# EAGLE design msx_slot2bus_expander (EAGLE 7.6.0)
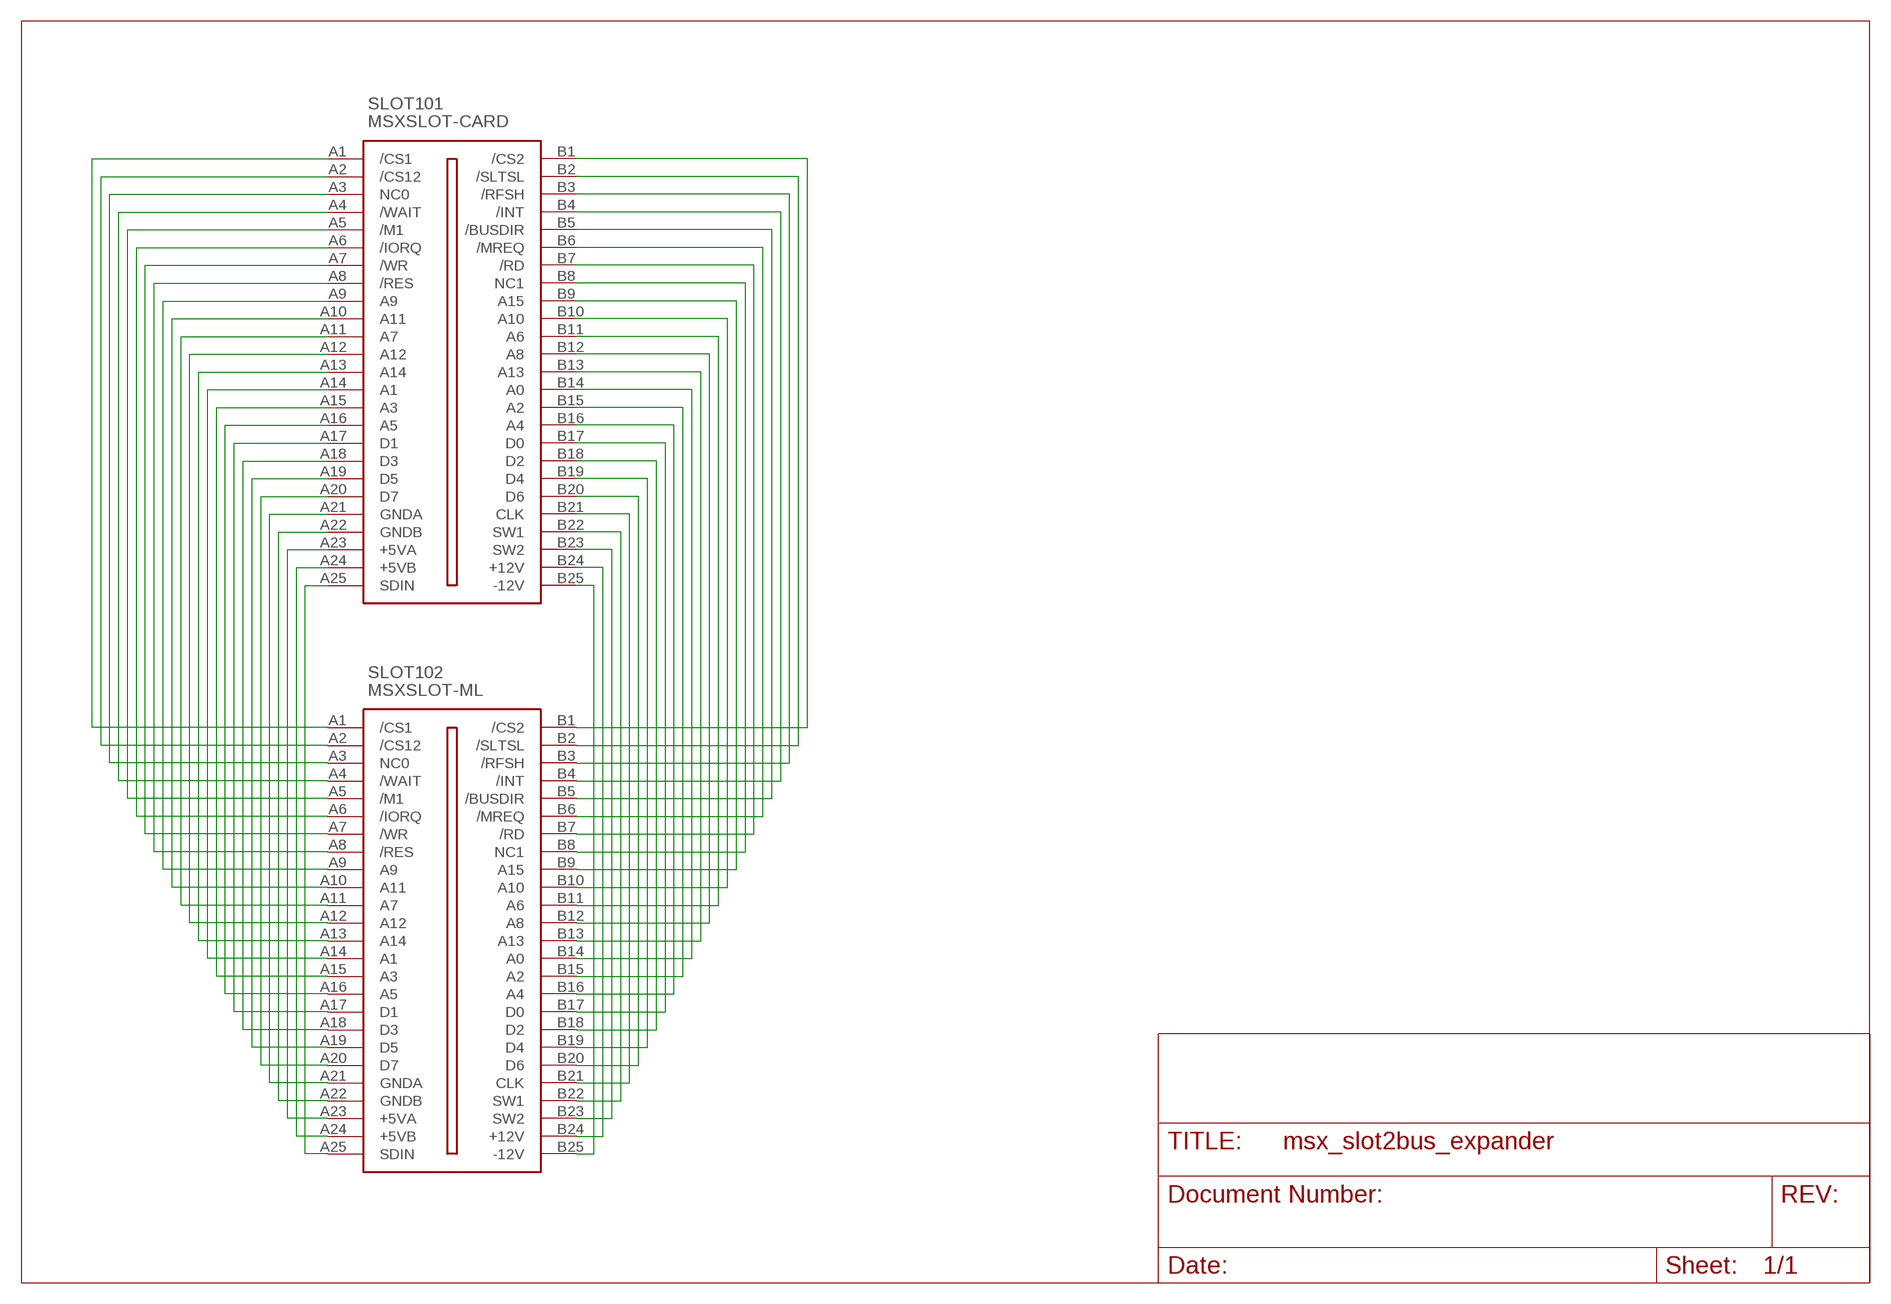
[diagram p0: schematic, sheet 1]

## Parts
SLOT101  MSXSLOT-CARD  [MSXCARD]
SLOT102  MSXSLOT-ML  [MSXSLOT-ML]

## Nets
N$1: SLOT101.A1(/CS1) SLOT102.A1(/CS1)
N$2: SLOT101.A2(/CS12) SLOT102.A2(/CS12)
N$3: SLOT101.A3(NC0) SLOT102.A3(NC0)
N$4: SLOT101.A4(/WAIT) SLOT102.A4(/WAIT)
N$5: SLOT101.A5(/M1) SLOT102.A5(/M1)
N$6: SLOT101.A6(/IORQ) SLOT102.A6(/IORQ)
N$7: SLOT101.A7(/WR) SLOT102.A7(/WR)
N$8: SLOT101.A8(/RES) SLOT102.A8(/RES)
N$9: SLOT101.A9 SLOT102.A9
N$10: SLOT101.A10(A11) SLOT102.A10(A11)
N$11: SLOT101.A11(A7) SLOT102.A11(A7)
N$12: SLOT101.A12 SLOT102.A12
N$13: SLOT101.A13(A14) SLOT102.A13(A14)
N$14: SLOT101.A14(A1) SLOT102.A14(A1)
N$15: SLOT101.A15(A3) SLOT102.A15(A3)
N$16: SLOT101.A16(A5) SLOT102.A16(A5)
N$17: SLOT101.A17(D1) SLOT102.A17(D1)
N$18: SLOT101.A18(D3) SLOT102.A18(D3)
N$19: SLOT101.A19(D5) SLOT102.A19(D5)
N$20: SLOT101.A20(D7) SLOT102.A20(D7)
N$21: SLOT101.A21(GNDA) SLOT102.A21(GNDA)
N$22: SLOT101.A22(GNDB) SLOT102.A22(GNDB)
N$23: SLOT101.A23(+5VA) SLOT102.A23(+5VA)
N$24: SLOT101.A24(+5VB) SLOT102.A24(+5VB)
N$25: SLOT101.A25(SDIN) SLOT102.A25(SDIN)
N$26: SLOT101.B25(-12V) SLOT102.B25(-12V)
N$27: SLOT101.B24(+12V) SLOT102.B24(+12V)
N$28: SLOT101.B23(SW2) SLOT102.B23(SW2)
N$29: SLOT101.B22(SW1) SLOT102.B22(SW1)
N$30: SLOT101.B21(CLK) SLOT102.B21(CLK)
N$31: SLOT101.B20(D6) SLOT102.B20(D6)
N$32: SLOT101.B19(D4) SLOT102.B19(D4)
N$33: SLOT101.B18(D2) SLOT102.B18(D2)
N$34: SLOT101.B17(D0) SLOT102.B17(D0)
N$35: SLOT101.B16(A4) SLOT102.B16(A4)
N$36: SLOT101.B15(A2) SLOT102.B15(A2)
N$37: SLOT101.B14(A0) SLOT102.B14(A0)
N$38: SLOT101.B13(A13) SLOT102.B13(A13)
N$39: SLOT101.B12(A8) SLOT102.B12(A8)
N$40: SLOT101.B11(A6) SLOT102.B11(A6)
N$41: SLOT101.B10(A10) SLOT102.B10(A10)
N$42: SLOT101.B9(A15) SLOT102.B9(A15)
N$43: SLOT101.B8(NC1) SLOT102.B8(NC1)
N$44: SLOT101.B7(/RD) SLOT102.B7(/RD)
N$45: SLOT101.B6(/MREQ) SLOT102.B6(/MREQ)
N$46: SLOT101.B5(/BUSDIR) SLOT102.B5(/BUSDIR)
N$47: SLOT101.B4(/INT) SLOT102.B4(/INT)
N$48: SLOT101.B3(/RFSH) SLOT102.B3(/RFSH)
N$49: SLOT101.B2(/SLTSL) SLOT102.B2(/SLTSL)
N$50: SLOT101.B1(/CS2) SLOT102.B1(/CS2)

## Library data of the parts
SLOT101 SLOT102 = mbc:MSXSLOT: MSX-Slot-Verbinder

## Board
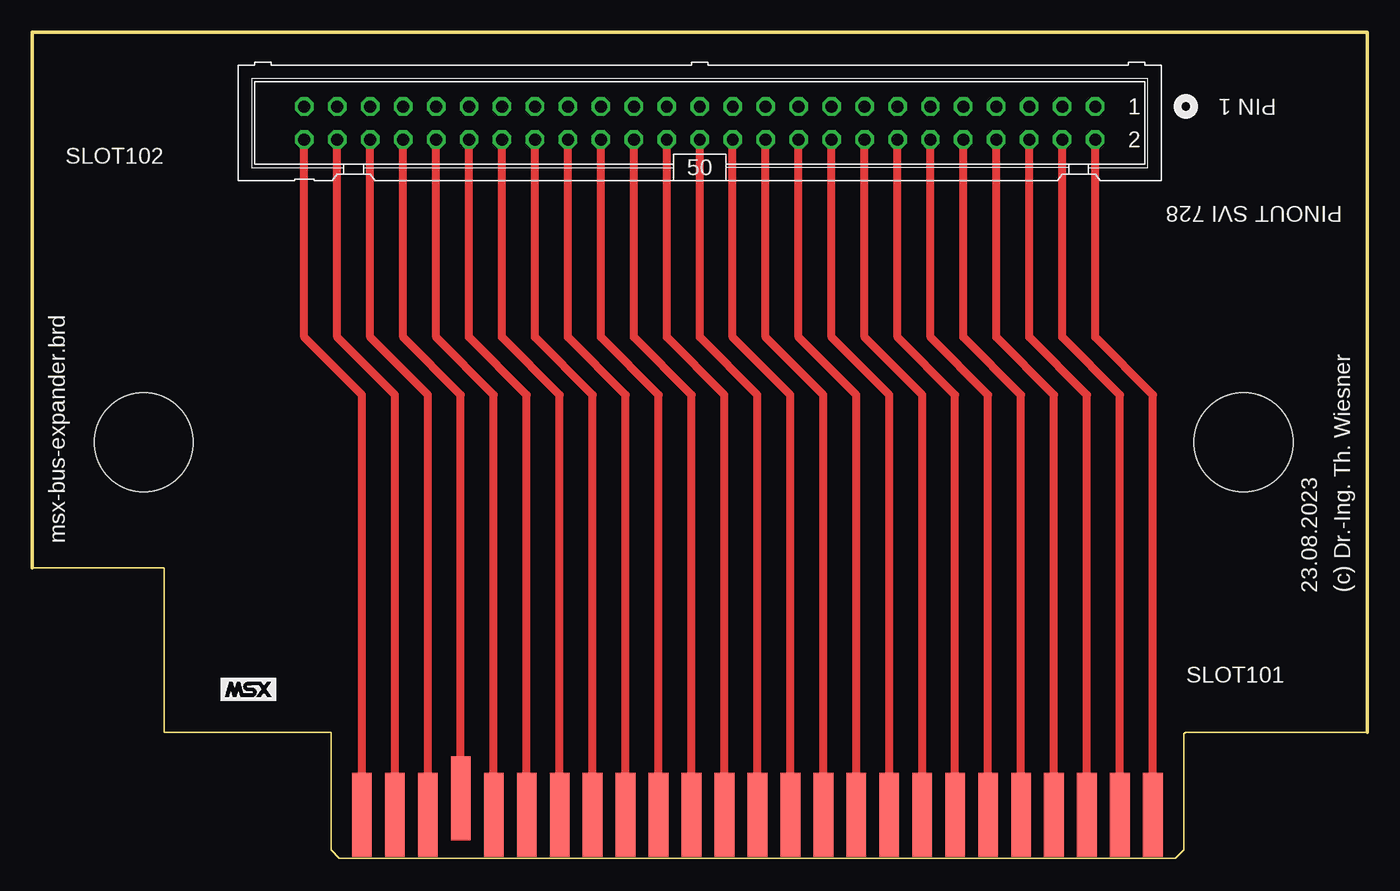
[diagram p1: board, top side]
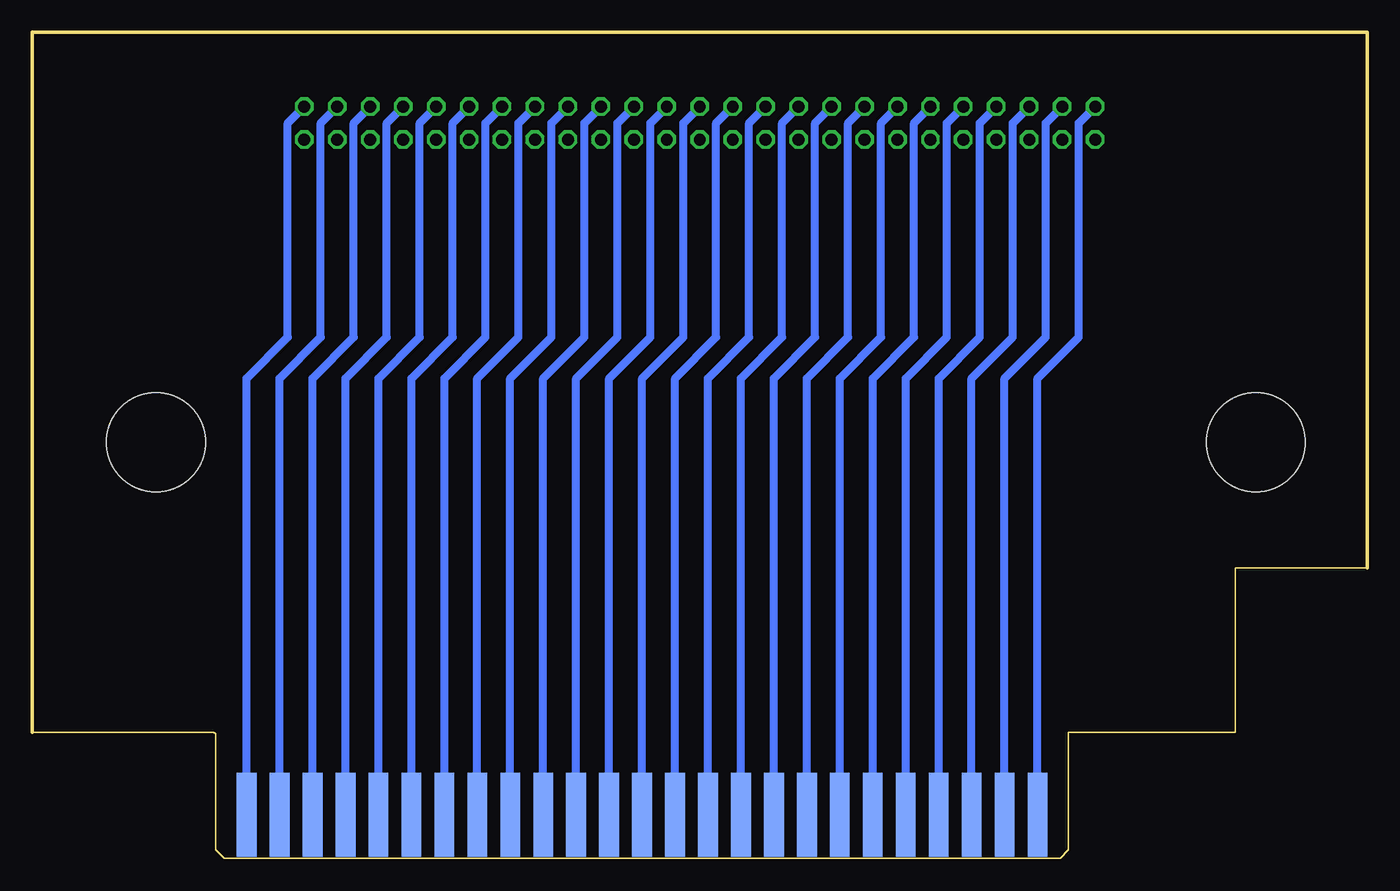
[diagram p2: board, bottom side, seen from below]

Size 102.87 x 63.66 mm. Coordinates in mm from the lower left corner, seen from the top.
Outline: 0,22.38 0,63.66 102.87,63.66 102.87,9.68
Copper layers (1*16): Top 0.035mm / dielectric 1.5mm / Bottom 0.035mm
Design rules "default": minimum track width 10mil, minimum drill 24mil, track to track 8mil, track to pad 8mil, pad to pad 8mil, via to via 8mil, smd to smd 8mil, copper to edge 40mil, drill to drill 8mil, minimum pad ring 10mil, minimum via ring 8mil, stop-mask expansion 4mil, vias tented up to drill 0mil, thermal gap 10mil

### Footprints (pad centres in the part's own frame; a part is rotated, then mirrored left to right if it is on the bottom)
MSXCARD = smd 1.524 x 6.477 bottom: A1 -25.4,2.54; A2 -27.94,2.54; A3 -30.48,2.54; A4 -33.02,2.54; A5 -35.56,2.54; A6 -38.1,2.54; A7 -40.64,2.54; A8 -43.18,2.54; A9 -45.72,2.54; A10 -48.26,2.54; A11 -50.8,2.54; A12 -53.34,2.54; A13 -55.88,2.54; A14 -58.42,2.54; A15 -60.96,2.54; A16 -63.5,2.54; A17 -66.04,2.54; A18 -68.58,2.54; A19 -71.12,2.54; A20 -73.66,2.54; A21 -76.2,2.54; A22 -78.74,2.54; A23 -81.28,2.54; A24 -83.82,2.54; A25 -86.36,2.54 | smd 1.524 x 6.477: B1 -25.4,2.54; B2 -27.94,2.54; B3 -30.48,2.54; B4 -33.02,2.54; B5 -35.56,2.54; B6 -38.1,2.54; B7 -40.64,2.54; B8 -43.18,2.54; B9 -45.72,2.54; B10 -48.26,2.54; B11 -50.8,2.54; B12 -53.34,2.54; B13 -55.88,2.54; B14 -58.42,2.54; B15 -60.96,2.54; B16 -63.5,2.54; B17 -66.04,2.54; B18 -68.58,2.54; B19 -71.12,2.54; B20 -73.66,2.54; B21 -76.2,2.54; B22 -78.74,3.81; B23 -81.28,2.54; B24 -83.82,2.54; B25 -86.36,2.54 | hole 7.62: -103.188,31.274; -18.415,31.274
MSXSLOT-ML = drill 0.914 octagon: A1 30.48,1.27; A2 27.94,1.27; A3 25.4,1.27; A4 22.86,1.27; A5 20.32,1.27; A6 17.78,1.27; A7 15.24,1.27; A8 12.7,1.27; A9 10.16,1.27; A10 7.62,1.27; A11 5.08,1.27; A12 2.54,1.27; A13 0,1.27; A14 -2.54,1.27; A15 -5.08,1.27; A16 -7.62,1.27; A17 -10.16,1.27; A18 -12.7,1.27; A19 -15.24,1.27; A20 -17.78,1.27; A21 -20.32,1.27; A22 -22.86,1.27; A23 -25.4,1.27; A24 -27.94,1.27; A25 -30.48,1.27; B1 30.48,-1.27; B2 27.94,-1.27; B3 25.4,-1.27; B4 22.86,-1.27; B5 20.32,-1.27; B6 17.78,-1.27; B7 15.24,-1.27; B8 12.7,-1.27; B9 10.16,-1.27; B10 7.62,-1.27; B11 5.08,-1.27; B12 2.54,-1.27; B13 0,-1.27; B14 -2.54,-1.27; B15 -5.08,-1.27; B16 -7.62,-1.27; B17 -10.16,-1.27; B18 -12.7,-1.27; B19 -15.24,-1.27; B20 -17.78,-1.27; B21 -20.32,-1.27; B22 -22.86,-1.27; B23 -25.4,-1.27; B24 -27.94,-1.27; B25 -30.48,-1.27

### Placement (x,y rotation side)
SLOT101  111.76,0.79 0 top
SLOT102  51.44,56.67 0 top

### Tracks (layer width: path | path; a pad name or v marks a point on that pad's centre or on a via)
N$1
  Bottom 0.61: SLOT101.A1 86.36,36.99 83.19,40.16 83.19,56.67 SLOT102.A1
N$2
  Bottom 0.61: SLOT101.A2 83.82,36.99 80.64,40.16 80.64,56.67 SLOT102.A2
N$3
  Bottom 0.61: SLOT101.A3 81.28,36.99 78.11,40.16 78.11,56.67 SLOT102.A3
N$4
  Bottom 0.61: SLOT101.A4 78.74,36.99 75.56,40.16 75.56,56.67 SLOT102.A4
N$5
  Bottom 0.61: SLOT101.A5 76.2,36.99 73.03,40.16 73.03,56.67 SLOT102.A5
N$6
  Bottom 0.61: SLOT101.A6 73.66,36.99 70.48,40.16 70.48,56.67 SLOT102.A6
N$7
  Bottom 0.61: SLOT101.A7 71.12,36.99 67.94,40.16 67.94,56.67 SLOT102.A7
N$8
  Bottom 0.61: SLOT101.A8 68.58,36.99 65.41,40.16 65.41,56.67 SLOT102.A8
N$9
  Bottom 0.61: SLOT101.A9 66.04,36.99 62.87,40.16 62.87,56.67 SLOT102.A9
N$10
  Bottom 0.61: SLOT101.A10 63.5,36.99 60.33,40.16 60.33,56.67 SLOT102.A10
N$11
  Bottom 0.61: SLOT101.A11 60.96,36.99 57.78,40.16 57.78,56.67 SLOT102.A11
N$12
  Bottom 0.61: SLOT101.A12 58.42,36.99 55.24,40.16 55.24,56.67 SLOT102.A12
N$13
  Bottom 0.61: SLOT101.A13 55.88,36.99 52.7,40.16 52.7,56.67 SLOT102.A13
N$14
  Bottom 0.61: SLOT101.A14 53.34,36.99 50.16,40.16 50.16,56.67 SLOT102.A14
N$15
  Bottom 0.61: SLOT101.A15 50.8,36.99 47.62,40.16 47.62,56.67 SLOT102.A15
N$16
  Bottom 0.61: SLOT101.A16 48.26,36.99 45.09,40.16 45.09,56.67 SLOT102.A16
N$17
  Bottom 0.61: SLOT101.A17 45.72,36.99 42.55,40.16 42.55,56.67 SLOT102.A17
N$18
  Bottom 0.61: SLOT101.A18 43.18,36.99 40.01,40.16 40.01,56.67 SLOT102.A18
N$19
  Bottom 0.61: SLOT101.A19 40.64,36.99 37.47,40.16 37.47,56.67 SLOT102.A19
N$20
  Bottom 0.61: SLOT101.A20 38.1,36.99 34.92,40.16 34.92,56.67 SLOT102.A20
N$21
  Bottom 0.61: SLOT101.A21 35.56,36.99 32.38,40.16 32.38,56.67 SLOT102.A21
N$22
  Bottom 0.61: SLOT101.A22 33.02,36.99 29.84,40.16 29.84,56.67 SLOT102.A22
N$23
  Bottom 0.61: SLOT101.A23 30.48,36.99 27.3,40.16 27.3,56.67 SLOT102.A23
N$24
  Bottom 0.61: SLOT101.A24 27.94,36.99 24.77,40.16 24.77,56.67 SLOT102.A24
N$25
  Bottom 0.61: SLOT101.A25 25.4,36.99 22.23,40.16 22.23,56.67 SLOT102.A25
N$26
  Top 0.61: SLOT101.B25 25.4,35.72 20.95,40.16 SLOT102.B25
N$27
  Top 0.61: SLOT101.B24 27.94,35.72 23.5,40.16 SLOT102.B24
N$28
  Top 0.61: SLOT101.B23 30.48,35.72 26.04,40.16 SLOT102.B23
N$29
  Top 0.61: SLOT101.B22 33.02,35.72 28.57,40.16 SLOT102.B22
N$30
  Top 0.61: SLOT101.B21 35.56,35.72 31.11,40.16 SLOT102.B21
N$31
  Top 0.61: SLOT101.B20 38.1,35.72 33.66,40.16 SLOT102.B20
N$32
  Top 0.61: SLOT101.B19 40.64,35.72 36.2,40.16 SLOT102.B19
N$33
  Top 0.61: SLOT101.B18 43.18,35.72 38.73,40.16 SLOT102.B18
N$34
  Top 0.61: SLOT101.B17 45.72,35.72 41.27,40.16 SLOT102.B17
N$35
  Top 0.61: SLOT101.B16 48.26,35.72 43.81,40.16 SLOT102.B16
N$36
  Top 0.61: SLOT101.B15 50.8,35.72 46.35,40.16 SLOT102.B15
N$37
  Top 0.61: SLOT101.B14 53.34,35.72 48.9,40.16 SLOT102.B14
N$38
  Top 0.61: SLOT101.B13 55.88,35.72 51.44,40.16 SLOT102.B13
N$39
  Top 0.61: SLOT101.B12 58.42,35.72 53.98,40.16 SLOT102.B12
N$40
  Top 0.61: SLOT101.B11 60.96,35.72 56.52,40.16 SLOT102.B11
N$41
  Top 0.61: SLOT101.B10 63.5,35.72 59.05,40.16 SLOT102.B10
N$42
  Top 0.61: SLOT101.B9 66.04,35.72 61.59,40.16 SLOT102.B9
N$43
  Top 0.61: SLOT101.B8 68.58,35.72 64.14,40.16 SLOT102.B8
N$44
  Top 0.61: SLOT101.B7 71.12,35.72 66.67,40.16 SLOT102.B7
N$45
  Top 0.61: SLOT101.B6 73.66,35.72 69.22,40.16 SLOT102.B6
N$46
  Top 0.61: SLOT101.B5 76.2,35.72 71.75,40.16 SLOT102.B5
N$47
  Top 0.61: SLOT101.B4 78.74,35.72 74.3,40.16 SLOT102.B4
N$48
  Top 0.61: SLOT101.B3 81.28,35.72 76.83,40.16 SLOT102.B3
N$49
  Top 0.61: SLOT101.B2 83.82,35.72 79.38,40.16 SLOT102.B2
N$50
  Top 0.61: SLOT101.B1 86.36,35.72 81.92,40.16 SLOT102.B1

### Text on the board
tNames: PIN 1 | PINOUT SVI 728 | msx-bus-expander.brd | 23.08.2023 | (c) Dr.-Ing. Th. Wiesner